# Altium schematic sheet USB_Sec.SchDoc
size A4; DocumentNumber: 23; SheetNumber: 23; SheetTotal: 28
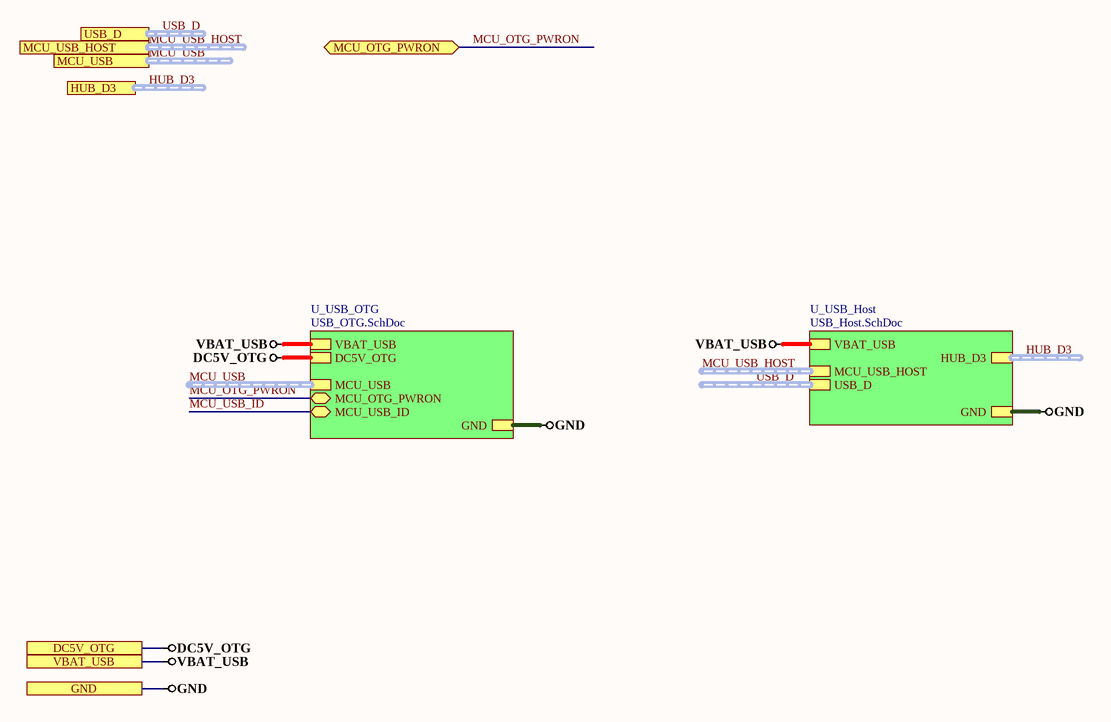
[diagram p0: USB_Sec.SchDoc]

## Sub-sheets
U_USB_Host = USB_Host.SchDoc: MCU_USB_HOST (harness MCU_USB_HOST), USB_D (harness USB_D), VBAT_USB, GND, HUB_D3 (harness HUB_D3)
U_USB_OTG = USB_OTG.SchDoc: MCU_USB (harness MCU_USB), MCU_OTG_PWRON (bidir), VBAT_USB, GND, MCU_USB_ID (bidir), DC5V_OTG

## Ports
DC5V_OTG, GND, HUB_D3 (harness HUB_D3), MCU_OTG_PWRON (bidir), MCU_USB (harness MCU_USB), MCU_USB_HOST (harness MCU_USB_HOST), USB_D (harness USB_D), VBAT_USB

## Nets
DC5V_OTG: port DC5V_OTG, sheet U_USB_OTG/DC5V_OTG
GND: port GND, sheet U_USB_OTG/GND, sheet U_USB_Host/GND
VBAT_USB: port VBAT_USB, sheet U_USB_OTG/VBAT_USB, sheet U_USB_Host/VBAT_USB
MCU_OTG_PWRON: port MCU_OTG_PWRON, sheet U_USB_OTG/MCU_OTG_PWRON
MCU_USB_ID: sheet U_USB_OTG/MCU_USB_ID

## Buses and harness runs
harness HUB_D3 = port HUB_D3
harness HUB_D3 = sheet U_USB_Host/HUB_D3
harness MCU_USB = port MCU_USB
harness MCU_USB = sheet U_USB_OTG/MCU_USB
harness MCU_USB_HOST = port MCU_USB_HOST
harness MCU_USB_HOST = sheet U_USB_Host/MCU_USB_HOST
harness USB_D = port USB_D
harness USB_D = sheet U_USB_Host/USB_D